# EAGLE design projet (EAGLE 9.6.2)
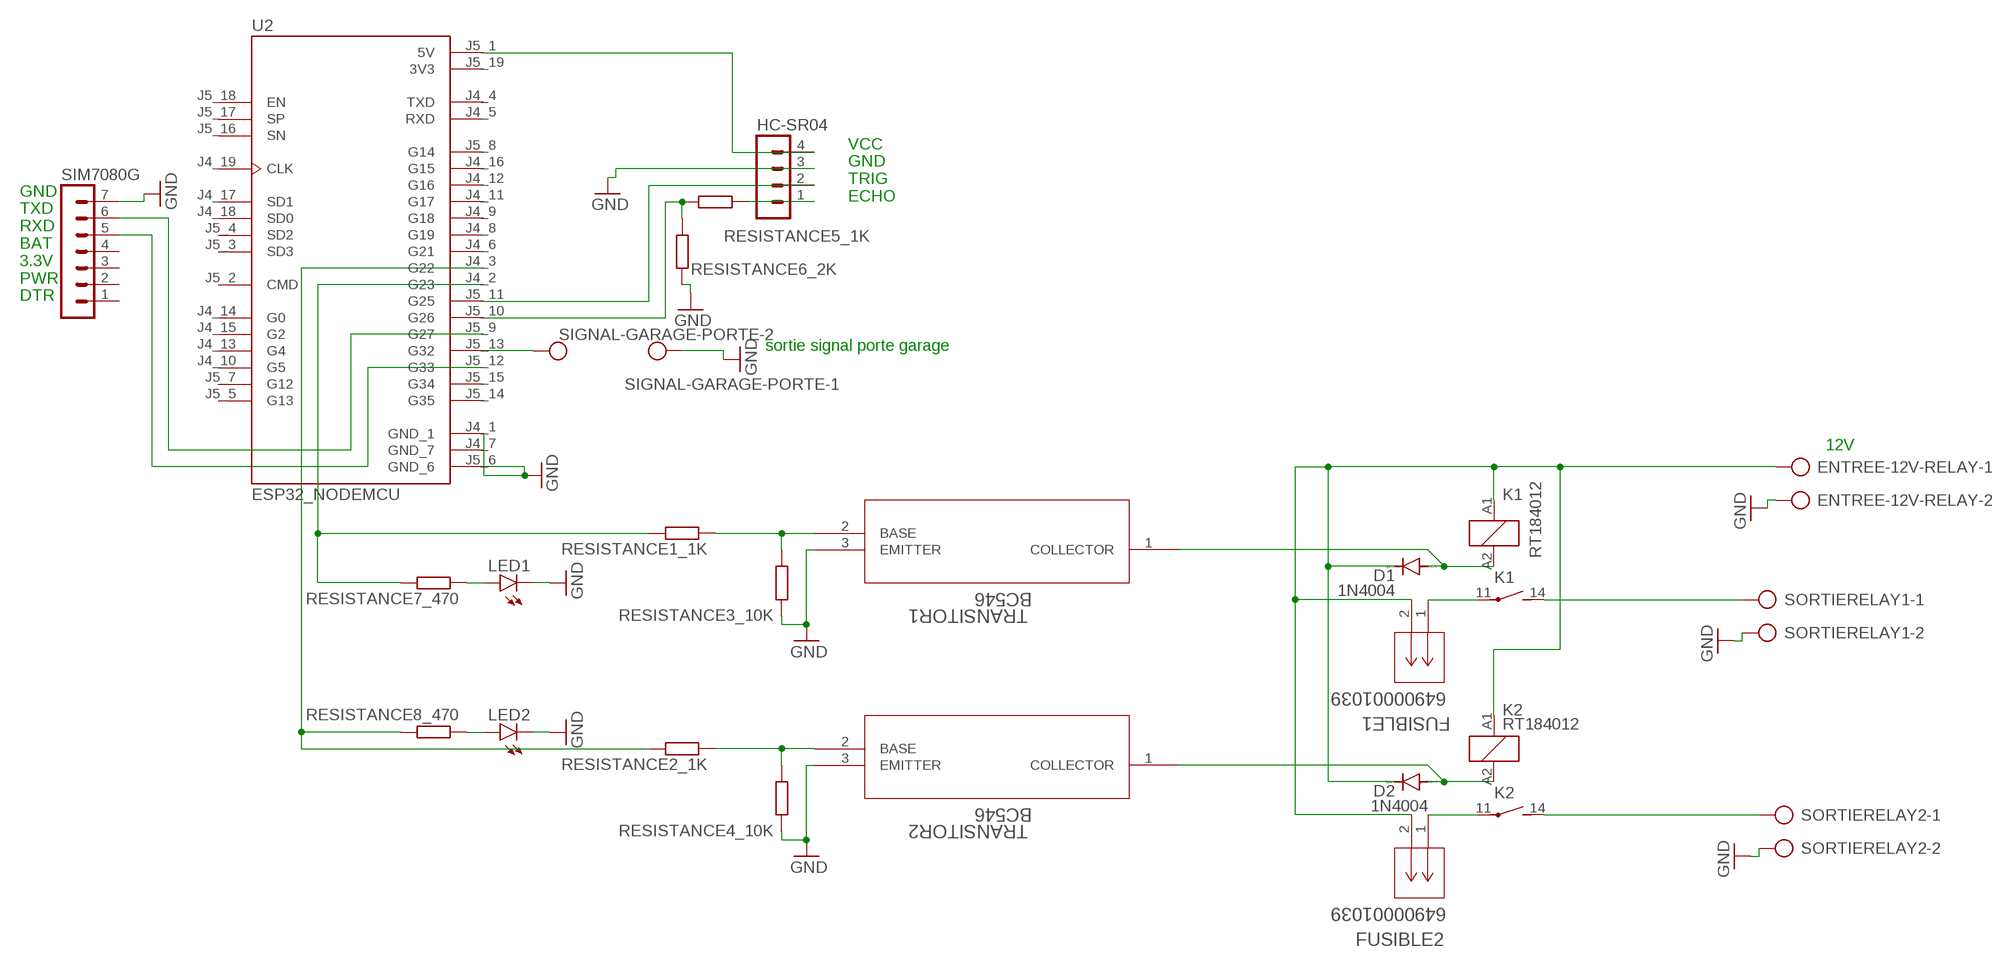
[diagram p0: schematic, sheet 1]

## Parts
D1  1N4004  [DO41-10]
D2  1N4004  [DO41-10]
ENTREE-12V-RELAY  AK300/2  [AK300/2]
FUSIBLE1  64900001039  [CONN02_FUSEBLOCK_22P6X9_LTF]
FUSIBLE2  64900001039  [CONN02_FUSEBLOCK_22P6X9_LTF]
HC-SR04  MA04-1  [MA04-1]
K1  RT184012  [RT-N/O12A3.5]
K2  RT184012  [RT-N/O12A3.5]
LED1  TLLY4400  [LED3MM]
LED2  TLLY4400  [LED3MM]
RESISTANCE1_1K  R-EU_0204/7  [0204/7]
RESISTANCE2_1K  R-EU_0204/7  [0204/7]
RESISTANCE3_10K  R-EU_0204/7  [0204/7]
RESISTANCE4_10K  R-EU_0204/7  [0204/7]
RESISTANCE5_1K  R-EU_0204/7  [0204/7]
RESISTANCE6_2K  R-EU_0204/7  [0204/7]
RESISTANCE7_470  R-EU_0204/7  [0204/7]
RESISTANCE8_470  R-EU_0204/7  [0204/7]
SIGNAL-GARAGE-PORTE  AK300/2  [AK300/2]
SIM7080G  MA07-1  [MA07-1]
SORTIERELAY1  AK300/2  [AK300/2]
SORTIERELAY2  AK300/2  [AK300/2]
TRANSITOR1  BC546  [TO-92_ONS]
TRANSITOR2  BC546  [TO-92_ONS]
U2  ESP32_NODEMCU  [MODULE_ESP32_NODEMCU]

## Nets
GND: ENTREE-12V-RELAY.2 HC-SR04.3 LED1.K(C) LED2.K(C) RESISTANCE3_10K.1 RESISTANCE4_10K.1 RESISTANCE6_2K.2 SIGNAL-GARAGE-PORTE.2 SIM7080G.7 SORTIERELAY1.2 SORTIERELAY2.2 TRANSITOR1.3(EMITTER) TRANSITOR2.3(EMITTER) U2.J4_1(GND_1) U2.J4_7(GND_7) U2.J5_6(GND_6)
N$1: RESISTANCE1_1K.1 RESISTANCE3_10K.2 TRANSITOR1.2(BASE)
N$2: SIGNAL-GARAGE-PORTE.1 U2.J5_13(G32)
N$3: RESISTANCE2_1K.1 RESISTANCE4_10K.2 TRANSITOR2.2(BASE)
N$4: RESISTANCE5_1K.1 RESISTANCE6_2K.1 U2.J5_10(G26)
N$5: LED2.A RESISTANCE8_470.1
N$6: D1.A K1.A2 TRANSITOR1.1(COLLECTOR)
N$7: K1.14(2:S) SORTIERELAY1.1
N$8: HC-SR04.2 U2.J5_11(G25)
N$9: D2.A K2.A2 TRANSITOR2.1(COLLECTOR)
N$10: HC-SR04.4 U2.J5_1(5V)
N$11: SIM7080G.5 U2.J5_12(G33)
N$12: K2.14(2:S) SORTIERELAY2.1
N$13: FUSIBLE1.1 K1.11(2:P)
N$14: FUSIBLE2.1 K2.11(2:P)
N$15: D1.C D2.C ENTREE-12V-RELAY.1 FUSIBLE1.2 FUSIBLE2.2 K1.A1 K2.A1
N$16: HC-SR04.1 RESISTANCE5_1K.2
N$17: LED1.A RESISTANCE7_470.1
N$18: RESISTANCE2_1K.2 RESISTANCE8_470.2 U2.J4_3(G22)
N$19: RESISTANCE1_1K.2 RESISTANCE7_470.2 U2.J4_2(G23)
N$21: SIM7080G.6 U2.J5_9(G27)
Unconnected: SIM7080G.1 SIM7080G.2 SIM7080G.3 SIM7080G.4 U2.J4_4(TXD) U2.J4_5(RXD) U2.J4_6(G21) U2.J4_8(G19) U2.J4_9(G18) U2.J4_10(G5) U2.J4_11(G17) U2.J4_12(G16) U2.J4_13(G4) U2.J4_14(G0) U2.J4_15(G2) U2.J4_16(G15) U2.J4_17(SD1) U2.J4_18(SD0) U2.J4_19(CLK) U2.J5_2(CMD) U2.J5_3(SD3) U2.J5_4(SD2) U2.J5_5(G13) U2.J5_7(G12) U2.J5_8(G14) U2.J5_14(G35) U2.J5_15(G34) U2.J5_16(SN) U2.J5_17(SP) U2.J5_18(EN)

## Notes on the sheet
- VCC
  GND
  TRIG
  ECHO
- GND
  TXD
  RXD
  BAT
  3.3V
  PWR
  DTR
- sortie signal porte garage
- 12V

## Power pins joined to a net without a drawn wire
3V3: U2.J5_19(3V3)

## Library data of the parts
D1 D2 = diode:1N4004: DIODE general purpose rectifier, 1 A
ENTREE-12V-RELAY SIGNAL-GARAGE-PORTE SORTIERELAY1 SORTIERELAY2 = con-ptr500:AK300/2: CONNECTOR; OC_FARNELL: unknown; OC_NEWARK: unknown
FUSIBLE1 FUSIBLE2 = portefusible:64900001039; COPYRIGHT: Copyright (C) 2026 Ultra Librarian. All rights reserved.; MANUFACTURER_NAME: Littelfuse Inc; MANUFACTURER_PART_NUMBER: 64900001039
HC-SR04 = con-lstb:MA04-1: PIN HEADER; OC_FARNELL: unknown; OC_NEWARK: unknown
K1 K2 = relay:RT?*: Power PCB Relay SCHRACK 1 pole 12 / 16 A, DC- or AC-coil Source: http://www.schrack.com/.. 5819.pdf; MF: TYCO ELECTRONICS; MPN: RT184012; OC_FARNELL: unknown; OC_NEWARK: 08H3731
LED1 LED2 = led:TLLY4400: Low Current (2mA) LED 3 mm Tinted Diffused Package color YELLOW Source: Data sheet <http://www.farnell.com/datasheets/391098.pdf>; MF: VISHAY SEMICONDUCTOR; OC_FARNELL: 1612439
RESISTANCE1_1K RESISTANCE2_1K RESISTANCE3_10K RESISTANCE4_10K RESISTANCE5_1K RESISTANCE6_2K RESISTANCE7_470 RESISTANCE8_470 = rcl:R-EU_: RESISTOR, European symbol; SPICEPREFIX: R
SIM7080G = con-lstb:MA07-1: PIN HEADER; OC_FARNELL: unknown; OC_NEWARK: unknown
TRANSITOR1 TRANSITOR2 = transi:BC546; COPYRIGHT: Copyright (C) 2026 Ultra Librarian. All rights reserved.; MANUFACTURER_NAME: onsemi; MANUFACTURER_PART_NUMBER: BC546
U2 = ESP32_NODEMCU:ESP32_NODEMCU; DATASHEET_URL: https://snapeda.s3.amazonaws.com/datasheets/ESP_-_32_NodeMCU_Developmentboard_Datenblatt_AZ-Delivery_Vertriebs_GmbH_10f68f6c-a9bb-49c6-a825-07979441739f.pdf; DESCRIPTION: NodeMCU is an open source loT platform. ESP32 is a series of low cost, low power system-on-chip (SoC) microcontrollers with integrated Wi-Fi and dual-mode Bluetooth.; MANUFACTURER: AZ Delivery; MAXIMUM_PACKAGE_HEIGHT: 6.6 mm; MPN: ESP32 NODEMCU; PACKAGE: Package; SOURCE_URL: https://www.snapeda.com/parts/ESP32%20NODEMCU/AZ+Displays/view-part/; STANDARD: Manufacturer Recommendations

## Board
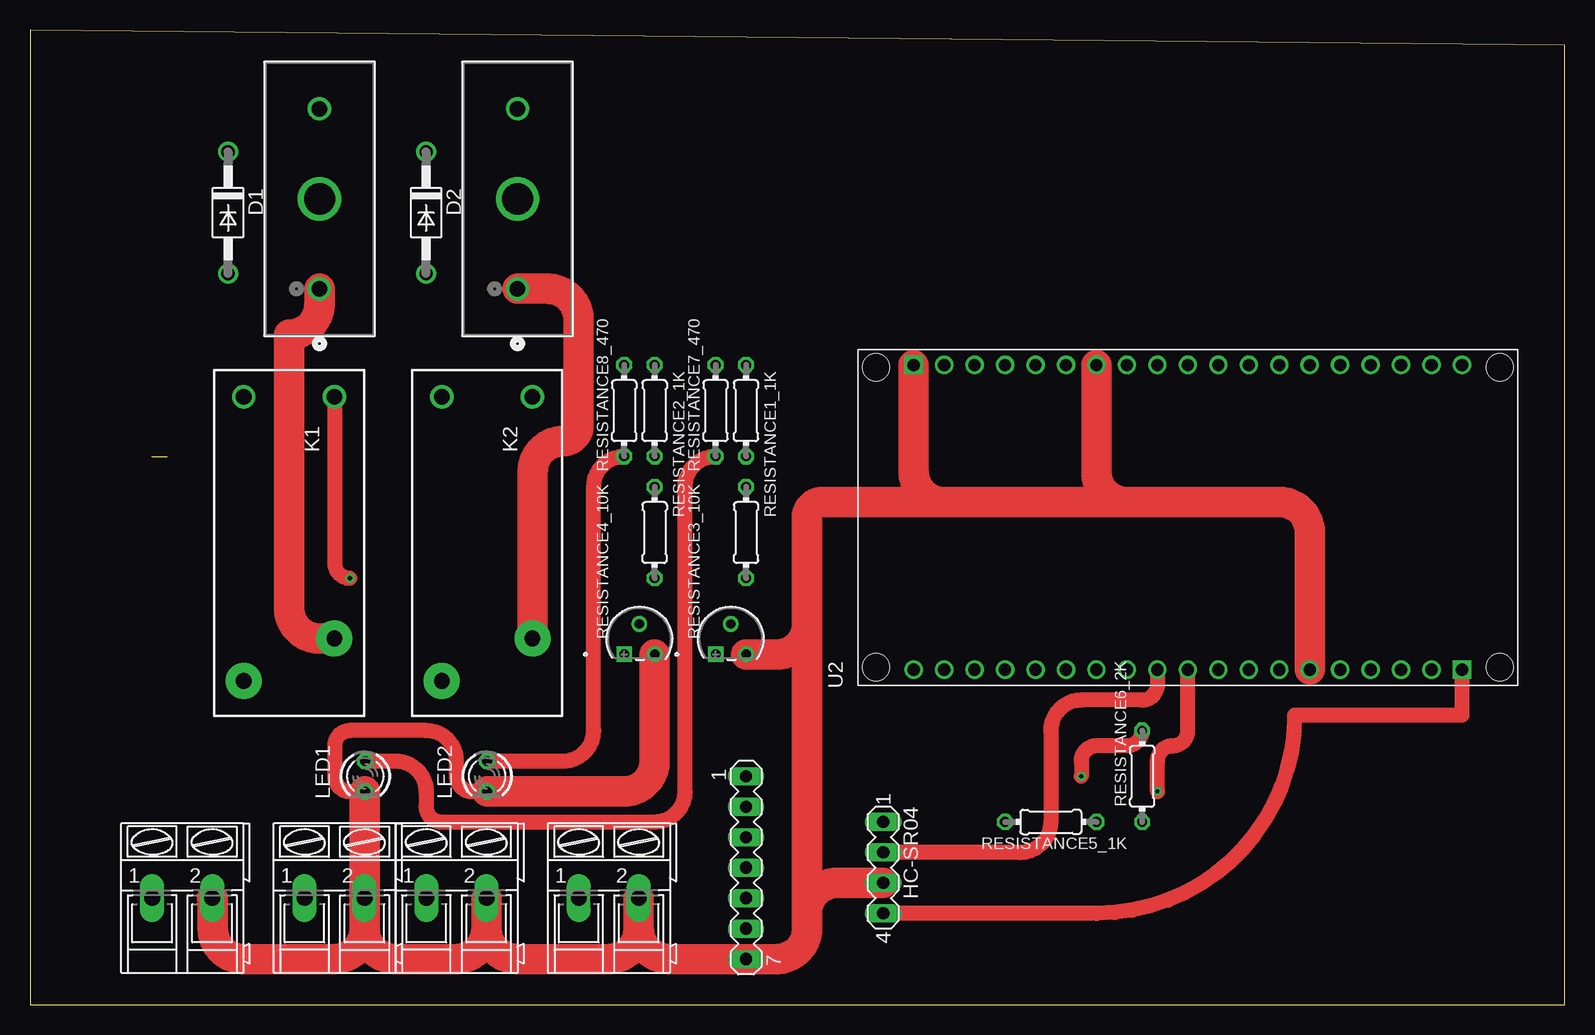
[diagram p1: board, top side]
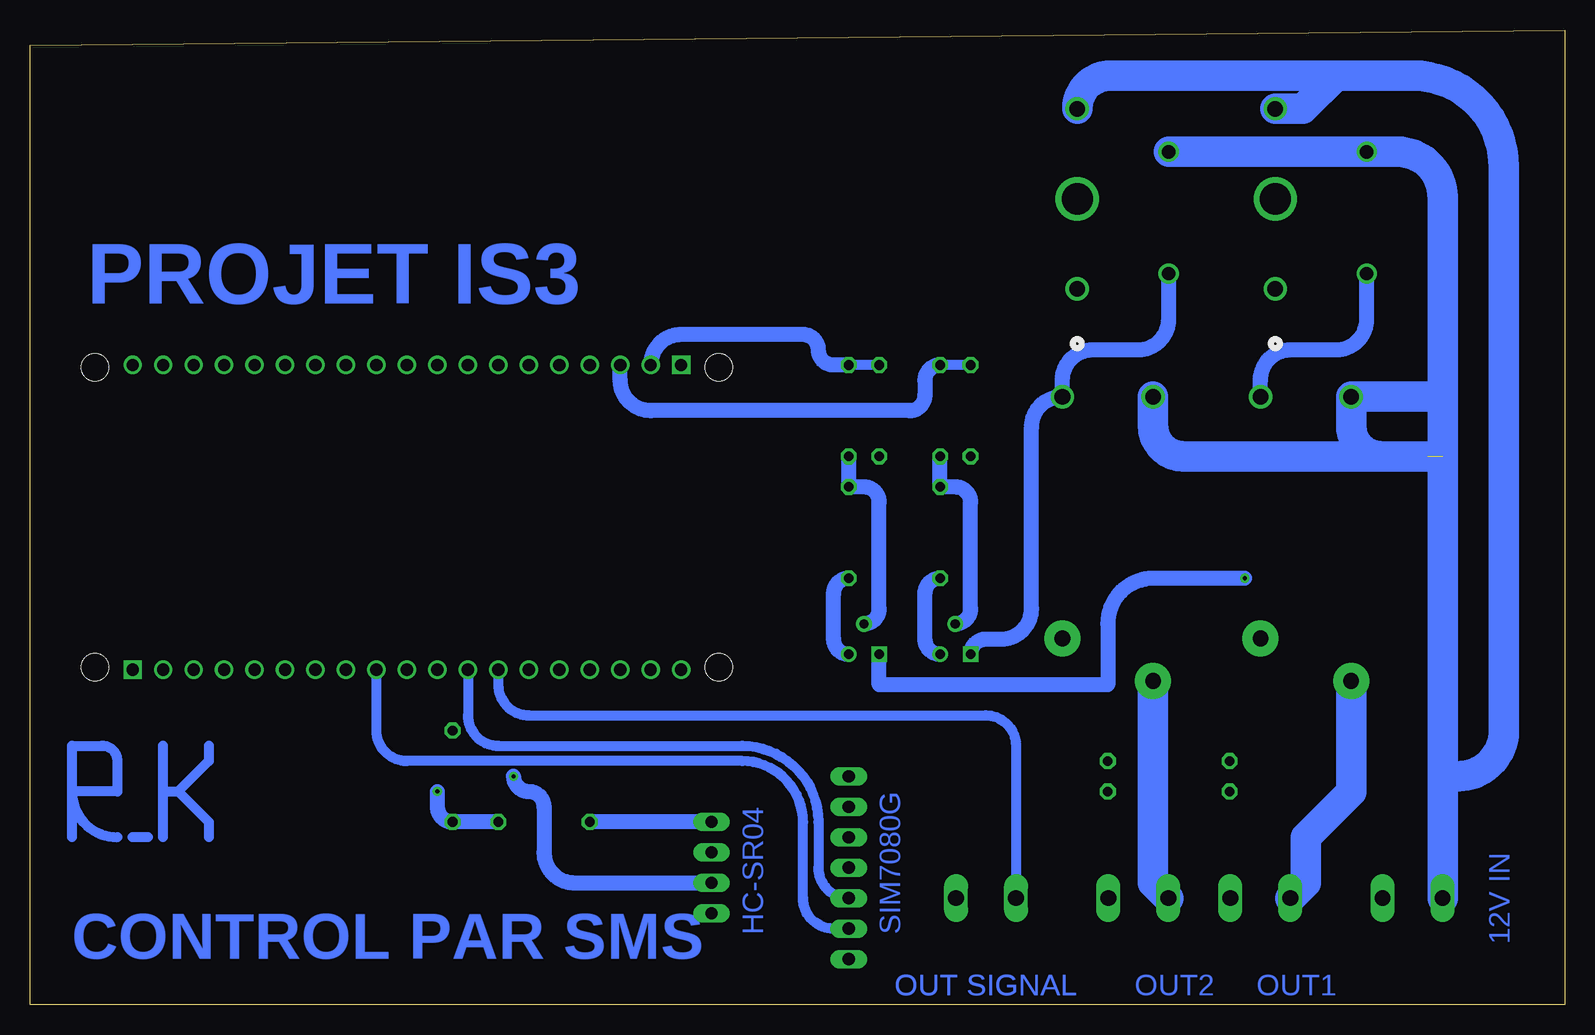
[diagram p2: board, bottom side, seen from below]

Size 127.94 x 81.27 mm. Coordinates in mm from the lower left corner, seen from the top.
Outline: 0,0 127.94,0 127.94,80 0,81.27 0,0
Copper layers (1*16): Top 0.035mm / dielectric 1.5mm / Bottom 0.035mm
Design rules "default": minimum track width 6mil, minimum drill 0.35mm, track to track 6mil, track to pad 6mil, pad to pad 6mil, via to via 6mil, smd to smd 6mil, copper to edge 40mil, drill to drill 6mil, minimum pad ring 10mil, minimum via ring 8mil, stop-mask expansion 4mil, vias tented up to drill 0mil, thermal gap 10mil

### Footprints (pad centres in the part's own frame; a part is rotated, then mirrored left to right if it is on the bottom)
DO41-10 = drill 1.118: A 5.08,0; C -5.08,0
AK300/2 = drill 1.321 long: 1 -2.515,0; 2 2.489,0
CONN02_FUSEBLOCK_22P6X9_LTF = drill 1.295 pad 1.803: 1 0,0; 2 15.011,0 | drill 2.591 pad 2.591: 3 7.493,0
MA04-1 = drill 1.016 long: 1 -3.81,0; 2 -1.27,0; 3 1.27,0; 4 3.81,0
RT-N/O12A3.5 = drill 1.3 pad 3: 11 7.56,3.78; 14 11.1,-3.78 | drill 1.3: A1 -12.6,-3.78; A2 -12.6,3.78
LED3MM = drill 0.813 octagon: A -1.27,0; K 1.27,0
0204/7 = drill 0.813 octagon: 1 -3.81,0; 2 3.81,0
MA07-1 = drill 1.016 long: 1 -7.62,0; 2 -5.08,0; 3 -2.54,0; 4 0,0; 5 2.54,0; 6 5.08,0; 7 7.62,0
TO-92_ONS = drill 0.787 pad 1.295 square: 1 0,0 | drill 0.787 pad 1.295: 2 1.27,2.54; 3 2.54,0
MODULE_ESP32_NODEMCU = drill 1.02 square: J4_1 12.7,22.86; J5_1 -12.7,-22.86 | drill 1.02: J4_2 12.7,20.32; J4_3 12.7,17.78; J4_4 12.7,15.24; J4_5 12.7,12.7; J4_6 12.7,10.16; J4_7 12.7,7.62; J4_8 12.7,5.08; J4_9 12.7,2.54; J4_10 12.7,0; J4_11 12.7,-2.54; J4_12 12.7,-5.08; J4_13 12.7,-7.62; J4_14 12.7,-10.16; J4_15 12.7,-12.7; J4_16 12.7,-15.24; J4_17 12.7,-17.78; J4_18 12.7,-20.32; J4_19 12.7,-22.86; J5_2 -12.7,-20.32; J5_3 -12.7,-17.78; J5_4 -12.7,-15.24; J5_5 -12.7,-12.7; J5_6 -12.7,-10.16; J5_7 -12.7,-7.62; J5_8 -12.7,-5.08; J5_9 -12.7,-2.54; J5_10 -12.7,0; J5_11 -12.7,2.54; J5_12 -12.7,5.08; J5_13 -12.7,7.62; J5_14 -12.7,10.16; J5_15 -12.7,12.7; J5_16 -12.7,15.24; J5_17 -12.7,17.78; J5_18 -12.7,20.32; J5_19 -12.7,22.86 | hole 2.25: -12.5,-26; 12.5,-26; -12.5,26; 12.5,26

### Placement (x,y rotation side)
D1  16.51,66.04 270 top
D2  33.02,66.04 270 top
ENTREE-12V-RELAY  12.7,8.89 0 top
FUSIBLE1  24.13,59.69 90 top
FUSIBLE2  40.64,59.69 90 top
HC-SR04  71.12,11.43 270 top
K1  21.59,38.1 270 top
K2  38.1,38.1 270 top
LED1  27.94,19.05 270 top
LED2  38.1,19.05 270 top
RESISTANCE1_1K  59.69,49.53 90 top
RESISTANCE2_1K  52.07,49.53 90 top
RESISTANCE3_10K  59.69,39.37 90 top
RESISTANCE4_10K  52.07,39.37 90 top
RESISTANCE5_1K  85.09,15.24 180 top
RESISTANCE6_2K  92.71,19.05 90 top
RESISTANCE7_470  57.15,49.53 90 top
RESISTANCE8_470  49.53,49.53 90 top
SIGNAL-GARAGE-PORTE  48.26,8.89 0 top
SIM7080G  59.69,11.43 270 top
SORTIERELAY1  25.4,8.89 0 top
SORTIERELAY2  35.56,8.89 0 top
TRANSITOR1  57.15,29.21 0 top
TRANSITOR2  49.53,29.21 0 top
U2  96.52,40.64 90 top

### Tracks (layer width: path | path; a pad name or v marks a point on that pad's centre or on a via)
GND  (via drill 0.35)
  Top 1.27: LED2.K 36.83,17.78 arc-90 35.56,19.05 35.56,20.32 arc90 33.02,22.86 26.67,22.86 arc90 25.4,21.59 25.4,19.05 arc90 26.67,17.78 LED1.K | RESISTANCE6_2K.2 arc-90 91.44,21.59 88.9,21.59 arc90 87.63,20.32 v87.63,19.05
  Top 2.54: U2.J5_6 106.68,39.37 arc90 104.14,41.91 91.44,41.91 | 91.44,41.91 arc-90 88.9,44.45 U2.J4_7 | 76.2,41.91 arc-90 73.66,44.45 U2.J4_1 | 76.2,41.91 91.44,41.91 | ENTREE-12V-RELAY.2 arc-90 15.24,8.84 15.24,6.35 arc90 17.78,3.81 25.35,3.81 arc90 27.89,6.35 | 38.05,6.35 arc-90 35.51,3.81 30.43,3.81 arc-90 27.89,6.35 | SORTIERELAY2.2 38.05,6.35 | 38.05,6.35 arc90 40.59,3.81 48.21,3.81 arc90 50.75,6.35 | 27.89,6.35 SORTIERELAY1.2 27.89,17.73 arc-90 LED1.K | 50.75,6.35 arc90 53.29,3.81 SIM7080G.7 62.23,3.81 arc90 64.77,6.35 64.77,7.62 | 50.75,6.35 SIGNAL-GARAGE-PORTE.2 | 64.77,7.62 arc-90 67.31,10.16 HC-SR04.3 | TRANSITOR2.3 52.07,20.32 arc-90 49.53,17.78 LED2.K | TRANSITOR1.3 62.23,29.21 arc90 64.77,31.75 | 64.77,31.75 64.77,33.02 64.77,40.64 arc-90 66.04,41.91 76.2,41.91 | 64.77,7.62 64.77,31.75
  Bottom 1.27: TRANSITOR2.3 arc90 53.34,30.48 53.34,34.29 arc90 RESISTANCE4_10K.1 | TRANSITOR1.3 arc90 60.96,30.48 60.96,34.29 arc90 RESISTANCE3_10K.1 | v87.63,19.05 arc-90 86.36,17.78 arc90 85.09,16.51 85.09,12.7 arc-90 82.55,10.16 HC-SR04.3
N$1
  Bottom 1.27: TRANSITOR1.2 arc-90 57.15,33.02 57.15,41.91 arc-90 58.42,43.18 RESISTANCE3_10K.2 RESISTANCE1_1K.1
N$2
  Bottom 0.813: U2.J5_13 88.9,26.67 arc-90 86.36,24.13 48.29,24.13 arc90 45.74,21.59 SIGNAL-GARAGE-PORTE.1
N$3
  Bottom 1.27: TRANSITOR2.2 arc-90 49.53,33.02 49.53,41.91 arc-90 50.8,43.18 RESISTANCE4_10K.2 RESISTANCE2_1K.1
N$4  (via drill 0.35)
  Top 1.27: v93.98,17.78 93.98,20.32 arc-90 95.25,21.59 arc90 96.52,22.86 U2.J5_10
  Bottom 1.27: RESISTANCE5_1K.1 RESISTANCE6_2K.1 arc90 93.98,16.51 v93.98,17.78
N$5
  Top 1.27: LED2.A 44.45,20.32 arc90 46.99,22.86 46.99,43.18 arc-90 RESISTANCE8_470.1
N$6  (via drill 0.35)
  Top 1.27: K1.A2 arc-90 25.4,50.67 25.4,36.83 arc90 v26.67,35.56
  Bottom 1.27: K1.A2 25.37,52.07 arc90 22.83,54.61 19.05,54.61 arc-90 16.51,57.15 D1.A | v26.67,35.56 34.29,35.56 arc-90 38.1,31.75 38.1,26.67 57.15,26.67 TRANSITOR1.1
N$7
  Bottom 2.54: K1.14 17.81,17.75 21.59,13.97 21.59,10.18 SORTIERELAY1.1
N$8
  Top 1.27: U2.J5_11 93.98,26.67 arc-90 92.71,25.4 87.63,25.4 arc90 85.09,22.86 85.09,15.24 arc-90 82.55,12.7 HC-SR04.2
N$9
  Bottom 1.27: D2.A 33.02,57.15 arc90 35.56,54.61 39.34,54.61 arc-90 41.88,52.07 K2.A2 41.91,50.7 arc-90 44.45,48.16 44.45,33.02 arc90 46.99,30.48 48.26,30.48 arc-90 TRANSITOR2.1
N$10
  Top 1.27: U2.J5_1 119.38,24.13 105.41,24.13 arc-90 88.9,7.62 HC-SR04.4
N$11
  Bottom 0.813: U2.J5_12 91.44,24.13 arc-90 88.9,21.59 68.58,21.59 arc90 62.23,15.24 62.23,11.43 arc-90 SIM7080G.5
N$12
  Bottom 2.54: K2.14 34.32,10.16 SORTIERELAY2.1
N$13
  Top 2.54: FUSIBLE1.1 24.13,58.42 arc-90 21.59,55.88 21.59,33.08 arc90 24.13,30.54 K1.11
N$14
  Top 2.54: K2.11 arc90 41.91,30.57 41.91,44.45 arc-90 44.45,46.99 arc90 45.72,48.26 45.72,57.15 arc90 43.18,59.69 FUSIBLE2.1
N$15  (1 unrouted)
  Bottom 2.54: FUSIBLE1.2 21.82,74.7 19.05,77.47 | 10.19,50.8 10.19,67.34 arc-90 13.97,71.12 D1.C D2.C | 10.19,19.05 10.19,50.8 | 10.19,19.05 8.89,19.05 arc-90 5.08,22.86 5.08,69.85 arc-90 12.7,77.47 19.05,77.47 | FUSIBLE2.2 arc90 37.87,77.47 19.05,77.47 | 10.19,19.05 ENTREE-12V-RELAY.1 | 10.29,50.7 arc-90 10.19,50.8 | 10.19,50.8 arc-90 10.29,50.7 | K2.A1 34.32,48.26 arc-90 31.78,45.72 11.43,45.72 | 10.29,50.7 K1.A1 17.81,48.26 arc-90 15.27,45.72 10.16,45.72
N$16
  Bottom 1.27: HC-SR04.1 RESISTANCE5_1K.2
N$17
  Top 1.27: LED1.A 30.48,20.32 arc-90 33.02,17.78 33.02,16.51 arc90 34.29,15.24 52.07,15.24 arc90 54.61,17.78 54.61,43.18 arc-90 RESISTANCE7_470.1
N$18
  Bottom 0.813: RESISTANCE8_470.2 RESISTANCE2_1K.2
  Bottom 1.27: RESISTANCE2_1K.2 arc-90 53.34,52.07 53.34,50.8 arc90 54.61,49.53 76.2,49.53 arc90 78.74,52.07 U2.J4_3
N$19
  Bottom 0.813: RESISTANCE7_470.2 RESISTANCE1_1K.2
  Bottom 1.27: RESISTANCE1_1K.2 60.96,53.34 arc90 62.23,54.61 arc-90 63.5,55.88 73.66,55.88 arc-90 U2.J4_2
N$20
  Bottom 0.813: 124.46,17.78 124.46,21.59 121.92,21.59 arc90 120.65,20.32 120.65,17.78 124.46,17.78 | 124.46,17.78 124.46,13.97 | 124.46,17.78 arc-90 120.65,13.97
N$21
  Bottom 0.813: U2.J5_9 99.06,22.86 arc-90 96.52,20.32 68.58,20.32 arc90 63.5,15.24 63.5,8.89 arc-90 60.96,6.35 SIM7080G.6
N$22
  Bottom 0.813: 118.11,13.97 119.38,13.97
N$23
  Bottom 0.813: 116.84,13.97 116.84,17.78 | 116.84,17.78 116.84,21.59 | 116.84,17.78 115.57,17.78 | 113.03,21.59 113.03,20.32 115.57,17.78 | 115.57,17.78 113.03,15.24 113.03,13.97

### Text on the board
Bottom: PROJET IS3 | SIM7080G | HC-SR04 | 12V IN | CONTROL PAR SMS | OUT1 | OUT2 | OUT SIGNAL | OUT SIGNAL